# Altium schematic sheet Power_Regulators.SchDoc
size A; DocumentNumber: 2; SheetNumber: 3; SheetTotal: 14
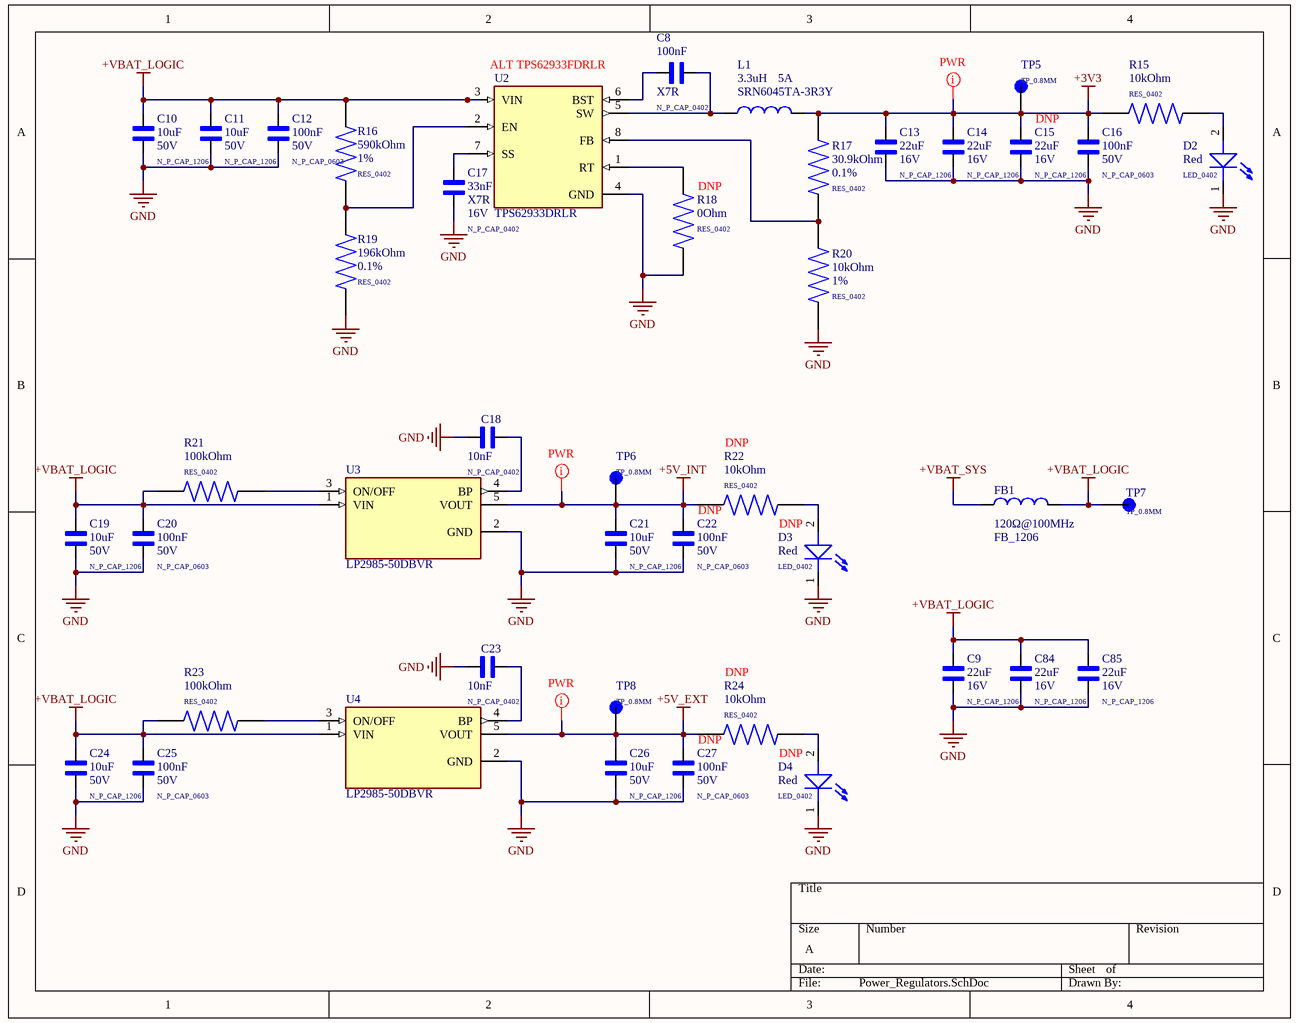
[diagram p0: Power_Regulators.SchDoc]

## Parts
C8  N_P_CAP_0402  value 100nF  Temperature Coefficient: X7R  [N_P_CAP_0402]
C9  N_P_CAP_1206  value 22uF  Rated Voltage: 16V  [N_P_CAP_1206]
C10  N_P_CAP_1206  value 10uF  Rated Voltage: 50V  [N_P_CAP_1206]
C11  N_P_CAP_1206  value 10uF  Rated Voltage: 50V  [N_P_CAP_1206]
C12  N_P_CAP_0603  value 100nF  Rated Voltage: 50V  [N_P_CAP_0603]
C13  N_P_CAP_1206  value 22uF  Rated Voltage: 16V  [N_P_CAP_1206]
C14  N_P_CAP_1206  value 22uF  Rated Voltage: 16V  [N_P_CAP_1206]
C15  N_P_CAP_1206  value 22uF  Rated Voltage: 16V  [N_P_CAP_1206]
C16  N_P_CAP_0603  value 100nF  Rated Voltage: 50V  [N_P_CAP_0603]
C17  N_P_CAP_0402  value 33nF  Temperature Coefficient: X7R  Rated Voltage: 16V  [N_P_CAP_0402]
C18  N_P_CAP_0402  value 10nF  [N_P_CAP_0402]
C19  N_P_CAP_1206  value 10uF  Rated Voltage: 50V  [N_P_CAP_1206]
C20  N_P_CAP_0603  value 100nF  Rated Voltage: 50V  [N_P_CAP_0603]
C21  N_P_CAP_1206  value 10uF  Rated Voltage: 50V  [N_P_CAP_1206]
C22  N_P_CAP_0603  value 100nF  Rated Voltage: 50V  [N_P_CAP_0603]
C23  N_P_CAP_0402  value 10nF  [N_P_CAP_0402]
C24  N_P_CAP_1206  value 10uF  Rated Voltage: 50V  [N_P_CAP_1206]
C25  N_P_CAP_0603  value 100nF  Rated Voltage: 50V  [N_P_CAP_0603]
C26  N_P_CAP_1206  value 10uF  Rated Voltage: 50V  [N_P_CAP_1206]
C27  N_P_CAP_0603  value 100nF  Rated Voltage: 50V  [N_P_CAP_0603]
C84  N_P_CAP_1206  value 22uF  Rated Voltage: 16V  [N_P_CAP_1206]
C85  N_P_CAP_1206  value 22uF  Rated Voltage: 16V  [N_P_CAP_1206]
D2  LED_0402  Color: Red  [LED_0402]
D3  LED_0402  Color: Red  [LED_0402]
D4  LED_0402  Color: Red  [LED_0402]
FB1  FB_1206  value 120Ω@100MHz  [FB_1206]
L1  value 3.3uH  MPN: SRN6045TA-3R3Y  Current Rating: 5A  [INDUCTOR_SRN6045TA-3R3Y]  (hidden comment: INDUCTOR_SRN6045TA-3R3Y)
R15  RES_0402  value 10kOhm  [RES_0402]
R16  RES_0402  value 590kOhm  Tolerance: 1%  [RES_0402]
R17  RES_0402  value 30.9kOhm  Tolerance: 0.1%  [RES_0402]
R18  RES_0402  value 0Ohm  [RES_0402]
R19  RES_0402  value 196kOhm  Tolerance: 0.1%  [RES_0402]
R20  RES_0402  value 10kOhm  Tolerance: 1%  [RES_0402]
R21  RES_0402  value 100kOhm  [RES_0402]
R22  RES_0402  value 10kOhm  [RES_0402]
R23  RES_0402  value 100kOhm  [RES_0402]
R24  RES_0402  value 10kOhm  [RES_0402]
TP5  TP_0.8MM  [TP_0.8MM]
TP6  TP_0.8MM  [TP_0.8MM]
TP7  TP_0.8MM  [TP_0.8MM]
TP8  TP_0.8MM  [TP_0.8MM]
U2  TPS62933DRLR  [SOTFL50P160X60-8N]
U3  LP2985-50DBVR  [SOT95P280X145-5N]
U4  LP2985-50DBVR  [SOT95P280X145-5N]

## Nets
+3V3: C13.2 C14.2 C15.2 C16.2 L1.2 R15.2 R17.2 TP5.TP
+5V_EXT: C26.2 C27.2 R24.2 TP8.TP U4.5(VOUT)
+5V_INT: C21.2 C22.2 R22.2 TP6.TP U3.5(VOUT)
+VBAT_LOGIC: C9.2 C10.2 C11.2 C12.2 C19.2 C20.2 C24.2 C25.2 C84.2 C85.2 FB1.2 R16.2 R21.1 R23.1 TP7.TP U2.3(VIN) U3.1(VIN) U4.1(VIN)
+VBAT_SYS: FB1.1
GND: C9.1 C10.1 C11.1 C12.1 C13.1 C14.1 C15.1 C16.1 C17.2 C18.1 C19.1 C20.1 C21.1 C22.1 C23.1 C24.1 C25.1 C26.1 C27.1 C84.1 C85.1 D2.1(K) D3.1(K) D4.1(K) R18.1 R19.1 R20.1 U2.4(GND) U3.2(GND) U4.2(GND)
NetC8_1: C8.1 L1.1 U2.5(SW)
NetC8_2: C8.2 U2.6(BST)
NetC17_1: C17.1 U2.7(SS)
NetC18_2: C18.2 U3.4(BP)
NetC23_2: C23.2 U4.4(BP)
NetD2_2: D2.2(A) R15.1
NetD3_2: D3.2(A) R22.1
NetD4_2: D4.2(A) R24.1
NetR16_1: R16.1 R19.2 U2.2(EN)
NetR17_1: R17.1 R20.2 U2.8(FB)
NetR18_2: R18.2 U2.1(RT)
NetR21_2: R21.2 U3.3(ON/OFF)
NetR23_2: R23.2 U4.3(ON/OFF)

## Layout directives
net class PWR: +3V3, +5V_EXT, +5V_INT

## Notes on the sheet
- (near U2) ALT TPS62933FDRLR
- DNP
- (near R18) DNP
- (near R22) DNP
- (near R24) DNP

## Library data of the parts
C8 = N_P_CAP: GENERIC NON-POLARIZED CAP; Rated Voltage: 25V; LCSC Part Number: C105883; Tolerance: *; MF: *; ESR: *; MPN: *
C9 C13-C15 C84 C85 = N_P_CAP: GENERIC NON-POLARIZED CAP; MPN: CL31A226KOHNNNE; Tolerance: 10%; LCSC Part Number: C90146; MF: *; ESR: *; Temperature Coefficient: *
C10-C12 C16 C17 C19-C22 C24-C27 = N_P_CAP: GENERIC NON-POLARIZED CAP; Tolerance: *; MF: *; ESR: *; MPN: *
  C10 C11 C19 C21 C24 C26: LCSC Part Number: C100122; Temperature Coefficient: *
  C12 C16 C20 C22 C25 C27: LCSC Part Number: C106221; Temperature Coefficient: *
  C17: LCSC Part Number: C723886
C18 C23 = N_P_CAP: GENERIC NON-POLARIZED CAP; Rated Voltage: 50V; LCSC Part Number: C60133; Tolerance: *; MF: *; ESR: *; MPN: *; Temperature Coefficient: *
D2-D4 = LED: GENERIC LED; MPN: *; Vf (Typ): *; Package: *; LCSC Part Number: C25503345; If (Max): *; MF: *
FB1 = FB: GENERIC FERRITE BEAD; MPN: BLM31KN121SN1L; DCR (Max): 9mOhm; Current Rating: 6A; LCSC Part Number: C337884; Idc (Max): *; Tolerance: *; MF: *
L1 = INDUCTOR: GENERIC INDUCTOR; MF: BOURNS; Isat: 7.8A; Tolerance: 30%; LCSC Part Number: *; Irms: *; DCR (Max): *
R15 R18 R21-R24 = RES: GENERIC RES; Tolerance: 1%; Power Rating: *; MPN: *; Rated Voltage: *; Temperature Coefficient: *
  R15 R22 R24: LCSC Part Number: C60490
  R18: LCSC Part Number: C106231
  R21 R23: LCSC Part Number: C60491
R16 R19 R20 = RES: GENERIC RES; Power Rating: *; MPN: *; Rated Voltage: *; Temperature Coefficient: *
  R16: LCSC Part Number: C477764
  R19: LCSC Part Number: C852585
  R20: LCSC Part Number: C60490
R17 = RES: GENERIC RES; MPN: RT0402BRD0730K9L; Power Rating: *; Rated Voltage: *; Temperature Coefficient: *; LCSC Part Number: C852715
TP5-TP8 = TEST_POINT: GENERIC TEST POINT; MF: *; MPN: *
U2 = TPS62933DRLR: 3.8-V to 30-V, 3-A, 200-kHz to 2.2-MHz, low-IQ synchronous buck converter in SOT-583 package; MF: Texas Instruments; Package: SOT-583 Texas Instruments; MPN: TPS62933DRLR; LCSC Part Number: C3200405
U3 U4 = LP2985-50DBVR: 150-mA, 16-V, low-dropout voltage regulator with enable; MF: Texas Instruments; Package: SOT-23-5 Texas Instruments; MPN: LP2985-50DBVR; LCSC Part Number: C74511